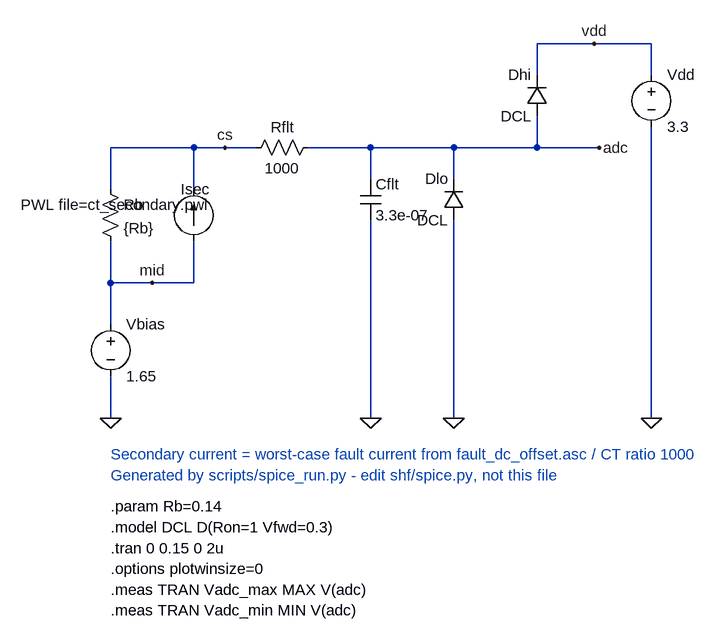
[diagram p0: schematic ct_adc_frontend.asc]
ct_adc_frontend.asc, the LTspice schematic file:
Version 4.1
SHEET 1 1120 960
WIRE 64 112 64 176
WIRE 192 112 64 112
WIRE 192 176 192 112
WIRE 288 112 192 112
WIRE 64 320 64 256
WIRE 64 384 64 320
WIRE 192 320 192 256
WIRE 192 320 64 320
WIRE 464 112 368 112
WIRE 592 112 464 112
WIRE 720 112 592 112
WIRE 816 112 720 112
WIRE 464 160 464 112
WIRE 592 160 592 112
WIRE 720 112 720 64
WIRE 720 0 720 -48
WIRE 896 -48 720 -48
WIRE 896 0 896 -48
WIRE 64 528 64 464
WIRE 464 528 464 224
WIRE 592 528 592 224
WIRE 896 528 896 80
FLAG 240 112 cs
FLAG 128 320 mid
FLAG 816 112 adc
FLAG 808 -48 vdd
FLAG 64 528 0
FLAG 464 528 0
FLAG 592 528 0
FLAG 896 528 0
SYMBOL res 48 160 R0
SYMATTR InstName Rb
SYMATTR Value {Rb}
SYMBOL current 192 256 R180
WINDOW 0 -24 80 Left 2
WINDOW 3 -24 56 Left 2
SYMATTR InstName Isec
SYMATTR Value PWL file=ct_secondary.pwl
SYMBOL voltage 64 368 R0
SYMATTR InstName Vbias
SYMATTR Value 1.65
SYMBOL res 384 96 R90
WINDOW 0 0 56 VBottom 2
WINDOW 3 32 56 VTop 2
SYMATTR InstName Rflt
SYMATTR Value 1000
SYMBOL cap 448 160 R0
SYMATTR InstName Cflt
SYMATTR Value 3.3e-07
SYMBOL diode 608 224 R180
WINDOW 0 24 64 Left 2
WINDOW 3 24 0 Left 2
SYMATTR InstName Dlo
SYMATTR Value DCL
SYMBOL diode 736 64 R180
WINDOW 0 24 64 Left 2
WINDOW 3 24 0 Left 2
SYMATTR InstName Dhi
SYMATTR Value DCL
SYMBOL voltage 896 -16 R0
SYMATTR InstName Vdd
SYMATTR Value 3.3
TEXT 64 584 Left 2 ;Secondary current = worst-case fault current from fault_dc_offset.asc / CT ratio 1000
TEXT 64 616 Left 2 ;Generated by scripts/spice_run.py - edit shf/spice.py, not this file
TEXT 64 664 Left 2 !.param Rb=0.14
TEXT 64 696 Left 2 !.model DCL D(Ron=1 Vfwd=0.3)
TEXT 64 728 Left 2 !.tran 0 0.15 0 2u
TEXT 64 760 Left 2 !.options plotwinsize=0
TEXT 64 792 Left 2 !.meas TRAN Vadc_max MAX V(adc)
TEXT 64 824 Left 2 !.meas TRAN Vadc_min MIN V(adc)

The netlist it stands for:
* ct_adc_frontend.asc
Rb cs mid {Rb}
Isec mid cs PWL file=ct_secondary.pwl
Vbias mid 0 1.65
Rflt adc cs 1000
Cflt adc 0 3.3e-07
Dlo 0 adc DCL
Dhi adc vdd DCL
Vdd vdd 0 3.3
.model D D
.lib standard.dio
* Secondary current = worst-case fault current from fault_dc_offset.asc / CT ratio 1000
* Generated by scripts/spice_run.py - edit shf/spice.py, not this file
.param Rb=0.14
.model DCL D(Ron=1 Vfwd=0.3)
.tran 0 0.15 0 2u
.options plotwinsize=0
.meas TRAN Vadc_max MAX V(adc)
.meas TRAN Vadc_min MIN V(adc)
.backanno
.end